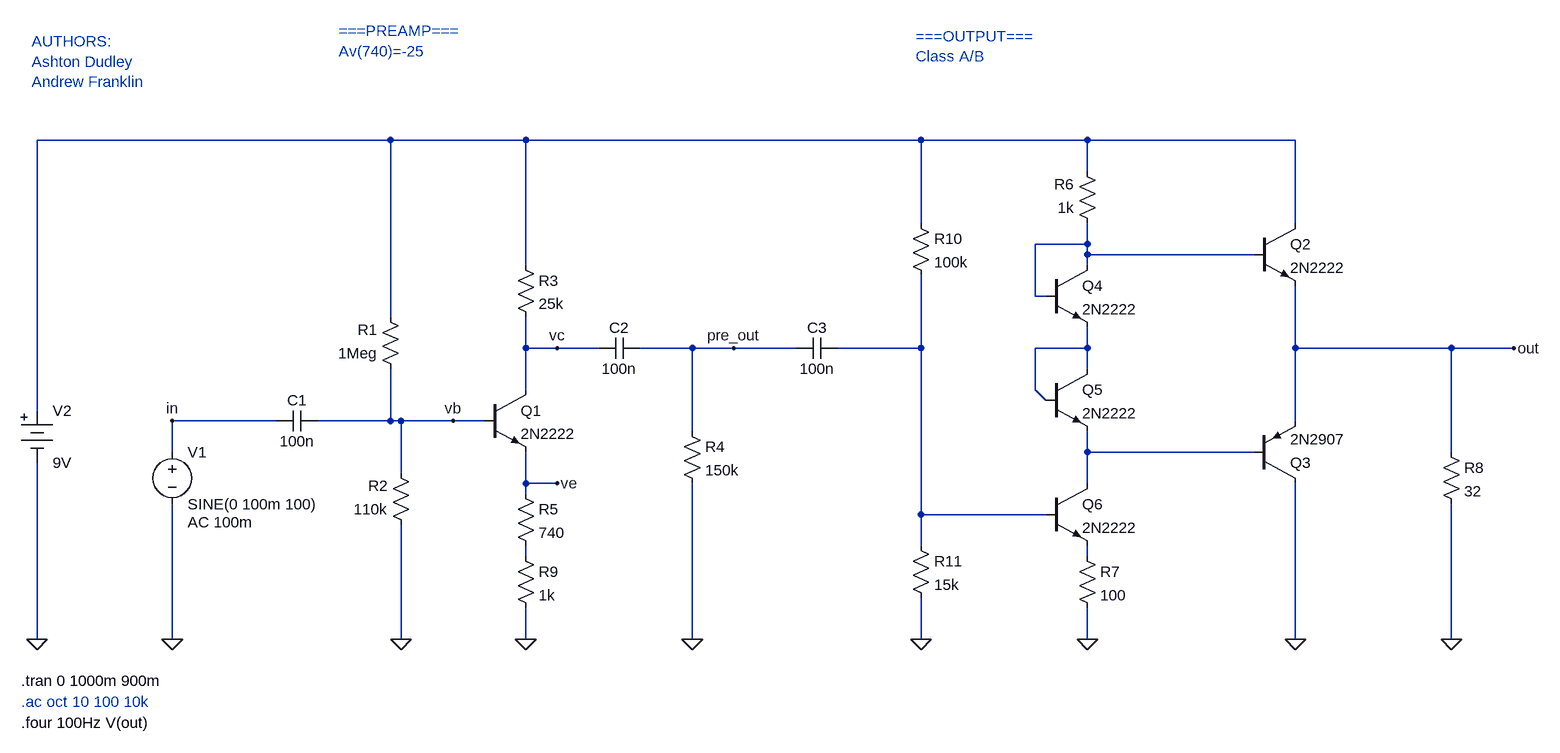
[diagram p0: schematic Guitar Pedal 261001.asc]
Guitar Pedal 261001.asc, the LTspice schematic file:
Version 4.1
SHEET 1 1784 720
WIRE 0 -304 -544 -304
WIRE 208 -304 0 -304
WIRE 816 -304 208 -304
WIRE 1072 -304 816 -304
WIRE 1392 -304 1072 -304
WIRE 1072 -256 1072 -304
WIRE 816 -176 816 -304
WIRE 1392 -176 1392 -304
WIRE 1072 -144 1072 -176
WIRE 1072 -144 992 -144
WIRE 1072 -128 1072 -144
WIRE 1328 -128 1072 -128
WIRE 208 -112 208 -304
WIRE 1072 -112 1072 -128
WIRE 992 -64 992 -144
WIRE 1008 -64 992 -64
WIRE 0 -32 0 -304
WIRE 208 16 208 -32
WIRE 256 16 208 16
WIRE 320 16 256 16
WIRE 464 16 384 16
WIRE 528 16 464 16
WIRE 624 16 528 16
WIRE 816 16 816 -96
WIRE 816 16 688 16
WIRE 1072 16 1072 -16
WIRE 1072 16 992 16
WIRE 1392 16 1392 -80
WIRE 1632 16 1392 16
WIRE 1728 16 1632 16
WIRE 1072 48 1072 16
WIRE 208 80 208 16
WIRE 992 80 992 16
WIRE 1008 96 992 80
WIRE -544 112 -544 -304
WIRE -176 128 -336 128
WIRE 0 128 0 48
WIRE 0 128 -112 128
WIRE 16 128 0 128
WIRE 96 128 16 128
WIRE 144 128 96 128
WIRE 1392 128 1392 16
WIRE 464 144 464 16
WIRE -336 176 -336 128
WIRE 1072 176 1072 144
WIRE 1328 176 1072 176
WIRE 1632 176 1632 16
WIRE 16 208 16 128
WIRE 208 224 208 176
WIRE 256 224 208 224
WIRE 1072 224 1072 176
WIRE 208 240 208 224
WIRE 816 272 816 16
WIRE 1008 272 816 272
WIRE 816 320 816 272
WIRE 208 336 208 320
WIRE 1072 336 1072 320
WIRE -544 464 -544 192
WIRE -336 464 -336 256
WIRE 16 464 16 288
WIRE 208 464 208 416
WIRE 464 464 464 224
WIRE 816 464 816 400
WIRE 1072 464 1072 416
WIRE 1392 464 1392 224
WIRE 1632 464 1632 256
FLAG 16 464 0
FLAG 464 464 0
FLAG 528 16 pre_out
FLAG -336 128 in
FLAG -336 464 0
FLAG 208 464 0
FLAG -544 464 0
FLAG 256 224 ve
FLAG 256 16 vc
FLAG 96 128 vb
FLAG 1072 464 0
FLAG 1392 464 0
FLAG 1632 464 0
FLAG 1728 16 out
FLAG 816 464 0
SYMBOL npn 144 80 R0
SYMATTR InstName Q1
SYMATTR Value 2N2222
SYMBOL res 16 64 R180
WINDOW 0 36 76 Left 2
WINDOW 3 36 40 Left 2
SYMATTR InstName R1
SYMATTR Value 1Meg
SYMBOL res 32 304 R180
WINDOW 0 36 76 Left 2
WINDOW 3 36 40 Left 2
SYMATTR InstName R2
SYMATTR Value 110k
SYMBOL voltage -336 160 R0
WINDOW 123 24 124 Left 2
WINDOW 39 0 0 Left 0
SYMATTR Value2 AC 100m
SYMATTR InstName V1
SYMATTR Value SINE(0 100m 100)
SYMBOL Misc\\battery -544 96 R0
WINDOW 123 0 0 Left 0
WINDOW 39 0 0 Left 0
SYMATTR InstName V2
SYMATTR Value 9V
SYMBOL cap -112 112 R90
WINDOW 0 0 32 VBottom 2
WINDOW 3 32 32 VTop 2
SYMATTR InstName C1
SYMATTR Value 100n
SYMBOL cap 384 0 R90
WINDOW 0 0 32 VBottom 2
WINDOW 3 32 32 VTop 2
SYMATTR InstName C2
SYMATTR Value 100n
SYMBOL res 192 -128 R0
SYMATTR InstName R3
SYMATTR Value 25k
SYMBOL res 448 128 R0
SYMATTR InstName R4
SYMATTR Value 150k
SYMBOL res 192 224 R0
SYMATTR InstName R5
SYMATTR Value 740
SYMBOL npn 1328 -176 R0
SYMATTR InstName Q2
SYMATTR Value 2N2222
SYMBOL pnp 1328 224 M180
SYMATTR InstName Q3
SYMATTR Value 2N2907
SYMBOL cap 624 32 R270
WINDOW 0 32 32 VTop 2
WINDOW 3 0 32 VBottom 2
SYMATTR InstName C3
SYMATTR Value 100n
SYMBOL npn 1008 -112 R0
SYMATTR InstName Q4
SYMATTR Value 2N2222
SYMBOL npn 1008 48 R0
SYMATTR InstName Q5
SYMATTR Value 2N2222
SYMBOL res 1088 -160 R180
WINDOW 0 36 76 Left 2
WINDOW 3 36 40 Left 2
SYMATTR InstName R6
SYMATTR Value 1k
SYMBOL res 1056 320 R0
SYMATTR InstName R7
SYMATTR Value 100
SYMBOL res 1616 160 R0
SYMATTR InstName R8
SYMATTR Value 32
SYMBOL res 192 320 R0
SYMATTR InstName R9
SYMATTR Value 1k
SYMBOL npn 1008 224 R0
SYMATTR InstName Q6
SYMATTR Value 2N2222
SYMBOL res 800 -192 R0
SYMATTR InstName R10
SYMATTR Value 100k
SYMBOL res 800 304 R0
SYMATTR InstName R11
SYMATTR Value 15k
TEXT -568 528 Left 2 !.tran 0 1000m 900m
TEXT -568 560 Left 2 ;.ac oct 10 100 10k
TEXT -568 592 Left 2 !.four 100Hz V(out)
TEXT -552 -456 Left 2 ;AUTHORS:\nAshton Dudley\nAndrew Franklin
TEXT -80 -472 Left 2 ;===PREAMP===\nAv(740)=-25
TEXT 808 -464 Left 2 ;===OUTPUT===\nClass A/B

The netlist it stands for:
* Guitar Pedal 261001.asc
Q1 vc vb ve 0 2N2222
R1 vb N001 1Meg
R2 0 vb 110k
V1 in 0 SINE(0 100m 100) AC 100m
V2 N001 0 9V
C1 vb in 100n
C2 pre_out vc 100n
R3 N001 vc 25k
R4 pre_out 0 150k
R5 ve N006 740
Q2 N001 N002 out 0 2N2222
Q3 0 N005 out 0 2N2907
C3 pre_out N003 100n
Q4 N002 N002 N004 0 2N2222
Q5 N004 N004 N005 0 2N2222
R6 N002 N001 1k
R7 N007 0 100
R8 out 0 32
R9 N006 0 1k
Q6 N005 N003 N007 0 2N2222
R10 N001 N003 100k
R11 N003 0 15k
.model NPN NPN
.model PNP PNP
.lib standard.bjt
.tran 0 1000m 900m
* .ac oct 10 100 10k
.four 100Hz V(out)
* AUTHORS:
* Ashton Dudley
* Andrew Franklin
* ===PREAMP===
* Av(740)=-25
* ===OUTPUT===
* Class A/B
.backanno
.end